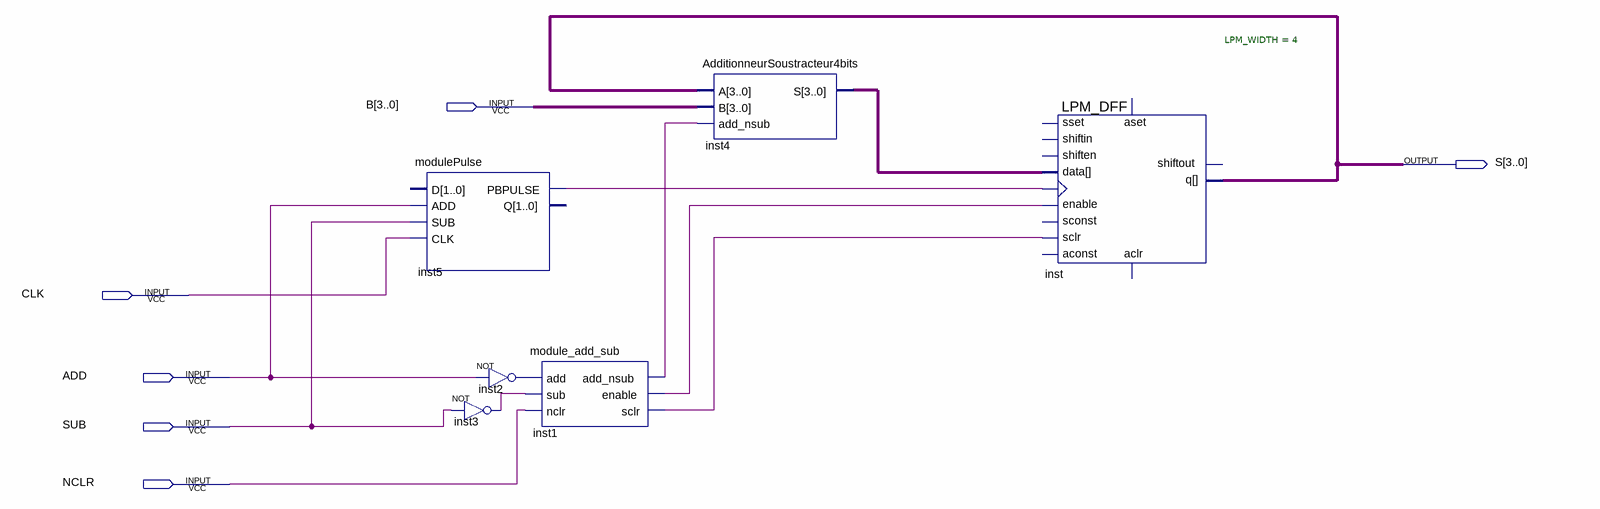
[diagram p0: schematic sheet]
// Quartus schematic main.bdf as structural Verilog: 6 symbols, 6 pins
module main (
  input  [3:0] B,
  input  CLK,
  input  ADD,
  input  SUB,
  input  NCLR,
  output [3:0] S
);

  wire inst1_add_nsub, inst1_enable, inst1_sclr, inst2_out, inst3_out, inst5_pbpulse;
  wire [3:0] inst4_s;

  modulePulse inst5 (.ADD(ADD), .SUB(SUB), .CLK(CLK), .PBPULSE(inst5_pbpulse));  // open: D, Q
  not inst3 (inst3_out, SUB);
  module_add_sub inst1 (
    .add(inst2_out), .sub(inst3_out), .nclr(NCLR), .add_nsub(inst1_add_nsub), .enable(inst1_enable),
    .sclr(inst1_sclr));
  not inst2 (inst2_out, ADD);
  AdditionneurSoustracteur4bits inst4 (.A(S), .B(B), .add_nsub(inst1_add_nsub), .S(inst4_s));
  LPM_DFF #(.LPM_WIDTH(4)) inst (
    .enable(inst1_enable), .clock(inst5_pbpulse), .data(inst4_s), .sclr(inst1_sclr), .q(S));  // open: shiftin, shiften, aconst, sconst, sset, aset, aclr, shiftout
endmodule
